# EAGLE design BioDes_HandProsthesis_PCB_V7 (EAGLE 9.6.2)

## Sheet 1 of 3
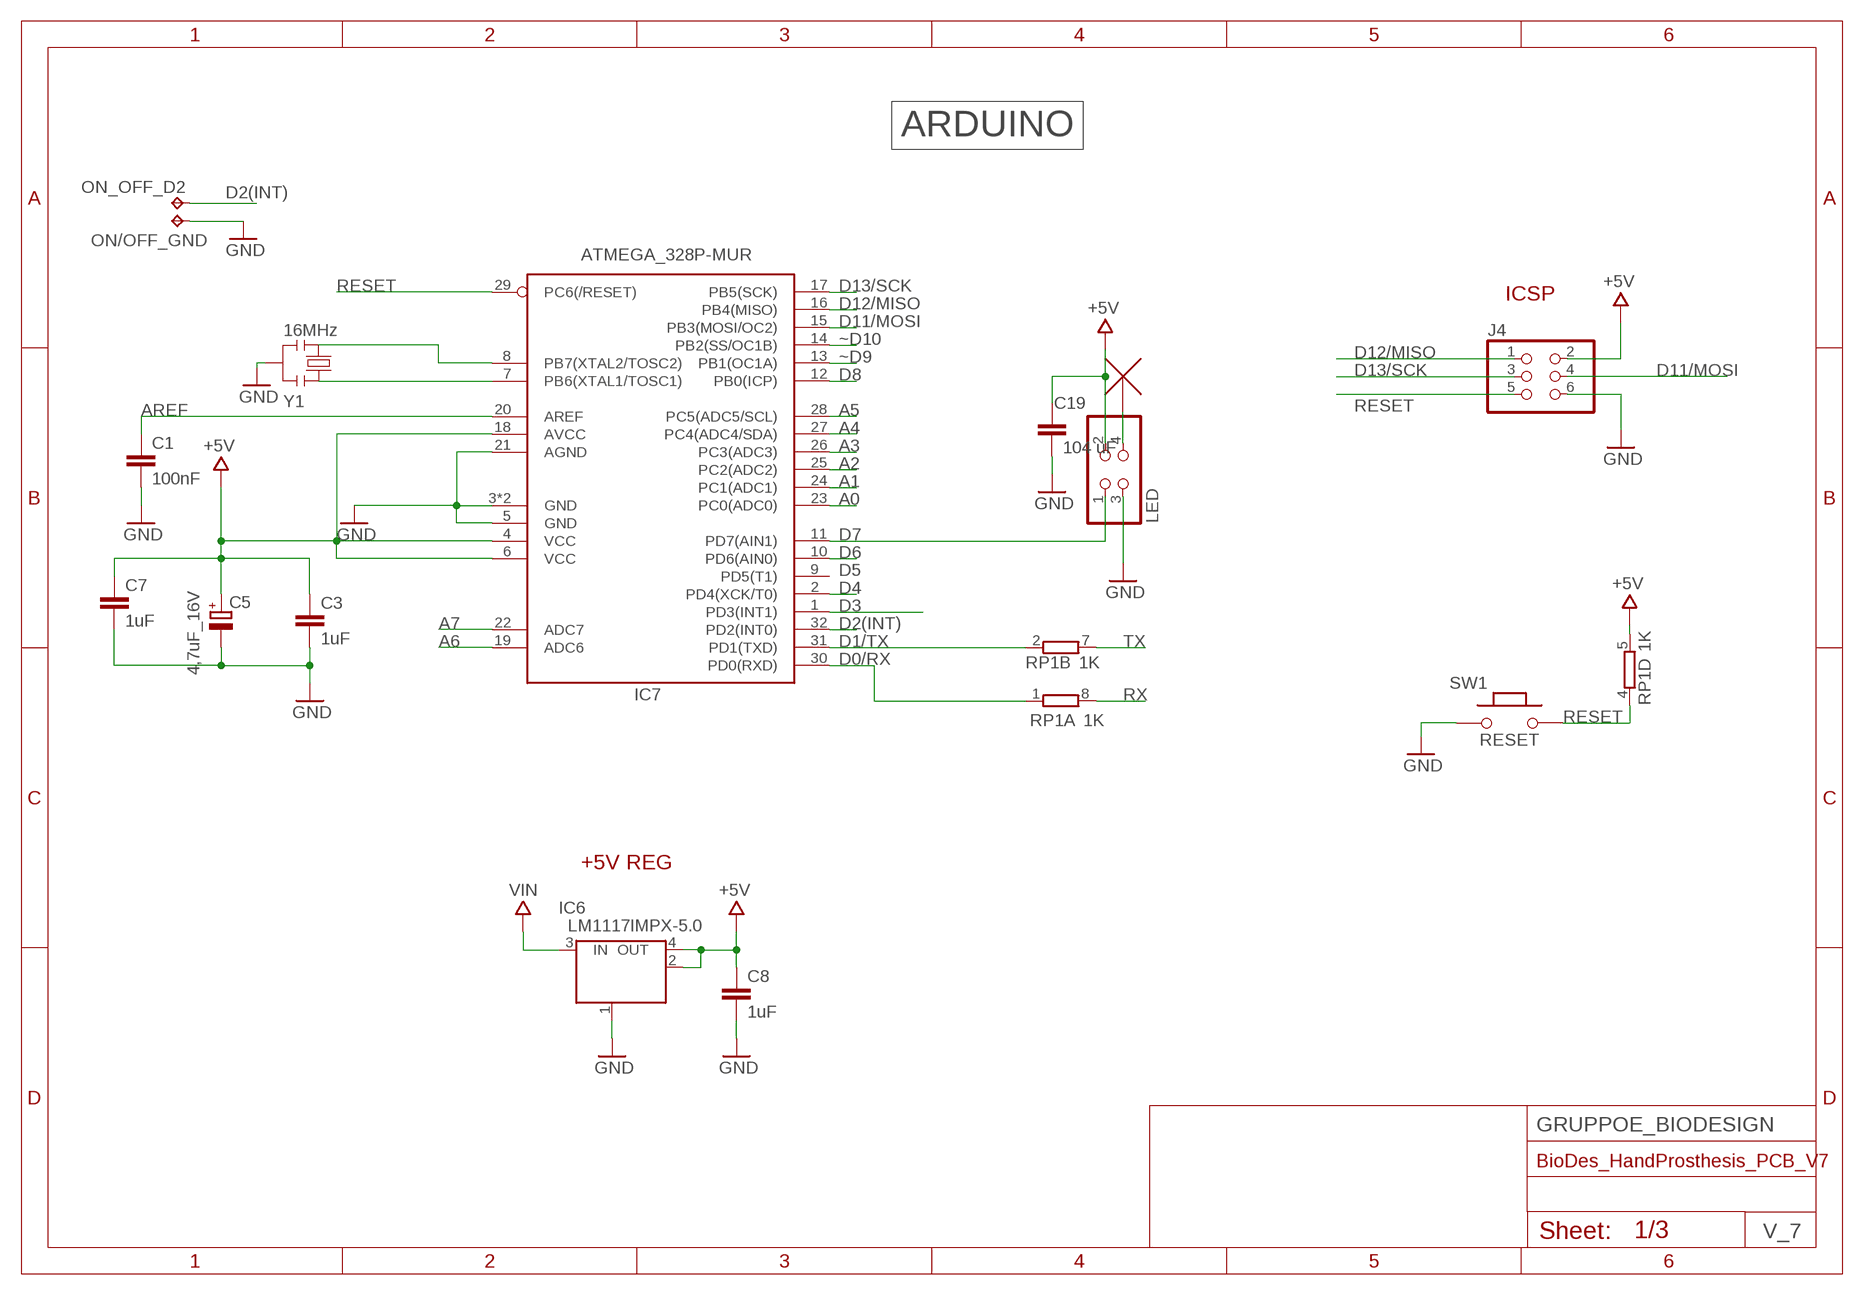
[diagram p0: schematic, sheet 1]

### Parts
C1  100nF  0015_100NF_0603  [C0603-ROUND]
C3  1uF  0006_1UF_0603/GRM188R61E105KA12D  [C0603-ROUND]
C5  4,7uF_16V  0833_TAJA475MO16RNJ  [TAN-A]
C7  1uF  0006_1UF_0603/GRM188R61E105KA12D  [C0603-ROUND]
C8  1uF  0006_1UF_0603/GRM188R61E105KA12D  [C0603-ROUND]
C19  104 uF  C-EUC0603  [C0603]
IC6  LM1117IMPX-5.0  0022_LM1117IMPX-5.0  [LINEAR_SOT223]
IC7  328P-MUR  ATMEGA328P-32MUR  [VQFN32]
J4  0114_PH254-203DF118A00V  [2X03]
LED  PINHD-2X2  [2X02]
ON/OFF_GND  TPB1,27  [B1,27]
ON_OFF_D2  TPB1,27  [B1,27]
RP1  1K  0005_064R_1K_/_CAY16-102J4LF  [CAY16]
SW1  RESET  0173_IT-1185AP1C-160G-G_T&R  [SMD_157SW]
U$7  NC_MARKER  (no package)
Y1  16MHz  0011_CSTCE16M0V53-R0  [RESONATOR]

### Nets
+5V: C3.1 C5.1(+) C7.1 C8.1 C19.1 IC6.2(OUT) IC6.4(OUT) IC7.4(VCC) IC7.6(VCC) IC7.18(AVCC) J4.2 LED.2 RP1.5 ; also sheet 2,3
A0: IC7.23(PC0(ADC0)) ; also sheet 2
A1: IC7.24(PC1(ADC1)) ; also sheet 2
A2: IC7.25(PC2(ADC2)) ; also sheet 2
A3: IC7.26(PC3(ADC3)) ; also sheet 2
A4: IC7.27(PC4(ADC4/SDA)) ; also sheet 2,3
A5: IC7.28(PC5(ADC5/SCL)) ; also sheet 2,3
A6: IC7.19(ADC6) ; also sheet 2
A7: IC7.22(ADC7) ; also sheet 2
AREF: C1.1 IC7.20(AREF)
D0/RX: IC7.30(PD0(RXD)) RP1.1
D1/TX: IC7.31(PD1(TXD)) RP1.2
D2(INT): IC7.32(PD2(INT0)) ON_OFF_D2.TP
D3: IC7.1(PD3(INT1)) ; also sheet 2
D4: IC7.2(PD4(XCK/T0)) ; also sheet 2
D6: IC7.10(PD6(AIN0)) ; also sheet 3
D7: IC7.11(PD7(AIN1)) LED.1
D8: IC7.12(PB0(ICP)) ; also sheet 2
D11/MOSI: IC7.15(PB3(MOSI/OC2)) J4.4
D12/MISO: IC7.16(PB4(MISO)) J4.1
D13/SCK: IC7.17(PB5(SCK)) J4.3
GND: C1.2 C3.2 C5.2(-) C7.2 C8.2 C19.2 IC6.1(GND/ADJ) IC7.3(GND) IC7.5(GND) IC7.21(AGND) IC7.33(GND) J4.6 LED.3 ON/OFF_GND.TP SW1.1 Y1.2 ; also sheet 2,3
N$3: LED.4 U$7.P$1
N$11: IC7.7(PB6(XTAL1/TOSC1)) Y1.1
N$12: IC7.8(PB7(XTAL2/TOSC2)) Y1.3
RESET: IC7.29(PC6(/RESET)) J4.5 RP1.4 SW1.2
RX: RP1.8 ; also sheet 2
TX: RP1.7 ; also sheet 2
VIN: IC6.3(IN) ; also sheet 3
~D9: IC7.13(PB1(OC1A)) ; also sheet 3
~D10: IC7.14(PB2(SS/OC1B)) ; also sheet 3
Unconnected: IC7.9(PD5(T1)) RP1.3 RP1.6

### Notes on the sheet
- ARDUINO
- ATMEGA_328P-MUR
- ICSP
- D5
- +5V REG
- GRUPPOE_BIODESIGN
- V_7

## Sheet 2 of 3
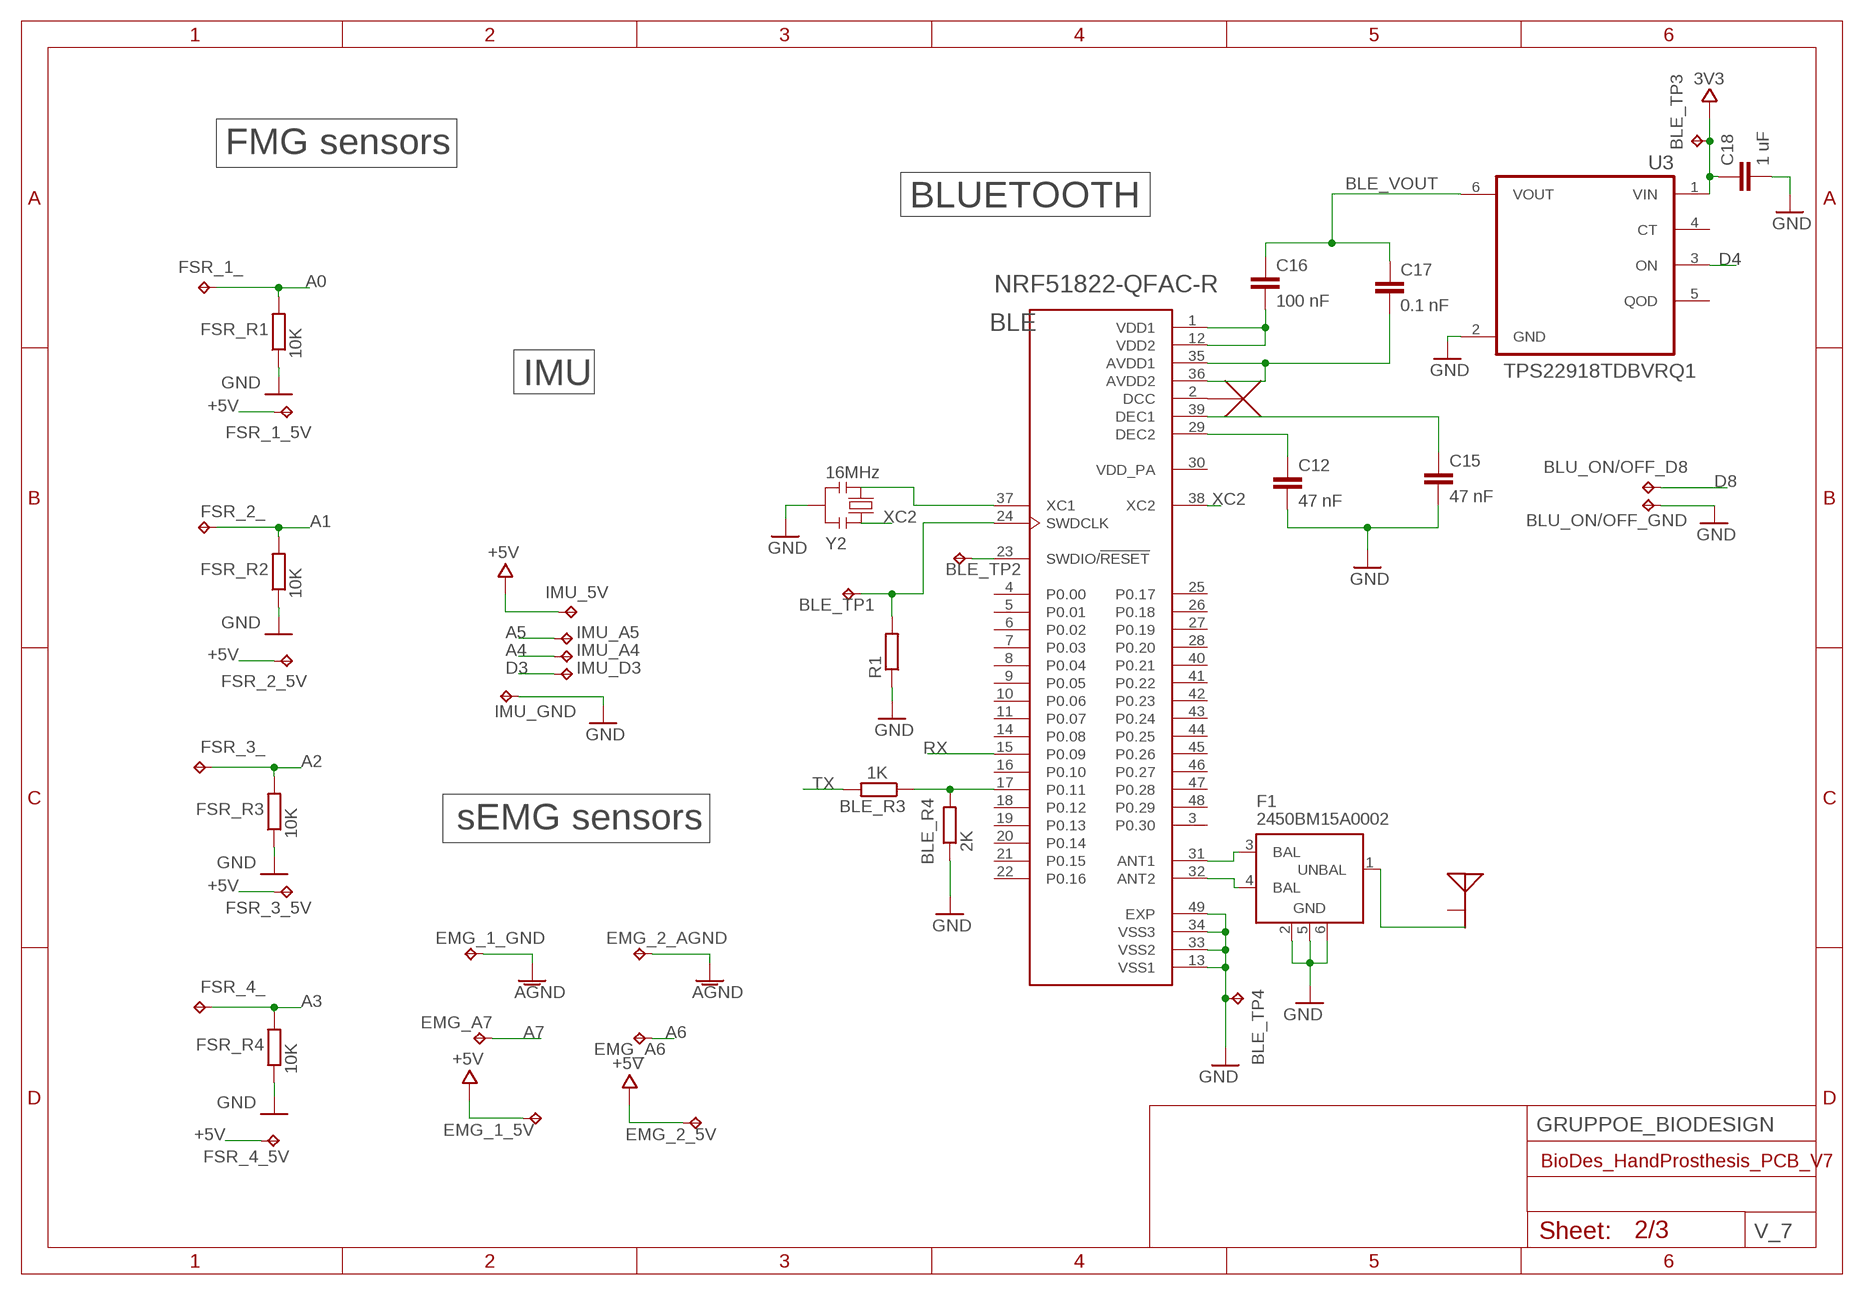
[diagram p1: schematic, sheet 2]

### Parts
BLE  NRF51822-QFAC-R  [QFN40P600X600X90-49N]
BLE_R3  1K  R-EU_R0603  [R0603]
BLE_R4  2K  R-EU_R0603  [R0603]
BLE_TP1  TPB1,27  [B1,27]
BLE_TP2  TPB1,27  [B1,27]
BLE_TP3  TPB1,27  [B1,27]
BLE_TP4  TPB1,27  [B1,27]
BLU_ON/OFF_D8  TPB1,27  [B1,27]
BLU_ON/OFF_GND  TPB1,27  [B1,27]
C12  47 nF  C-EUC0603  [C0603]
C15  47 nF  C-EUC0603  [C0603]
C16  100 nF  C-EUC0603  [C0603]
C17  0.1 nF  C-EUC0603  [C0603]
C18  1 uF  C-EUC0603  [C0603]
EMG_1_5V  TPB1,27  [B1,27]
EMG_1_GND  TPB1,27  [B1,27]
EMG_2_5V  TPB1,27  [B1,27]
EMG_2_AGND  TPB1,27  [B1,27]
EMG_A6  TPB1,27  [B1,27]
EMG_A7  TPB1,27  [B1,27]
F1  2450BM15A0002  [2450BM15A0002]
FSR_1_  TPB1,27  [B1,27]
FSR_1_5V  TPB1,27  [B1,27]
FSR_2_  TPB1,27  [B1,27]
FSR_2_5V  TPB1,27  [B1,27]
FSR_3_  TPB1,27  [B1,27]
FSR_3_5V  TPB1,27  [B1,27]
FSR_4_  TPB1,27  [B1,27]
FSR_4_5V  TPB1,27  [B1,27]
FSR_R1  10K  R-EU_R0603  [R0603]
FSR_R2  10K  R-EU_R0603  [R0603]
FSR_R3  10K  R-EU_R0603  [R0603]
FSR_R4  10K  R-EU_R0603  [R0603]
IMU_5V  TPB1,27  [B1,27]
IMU_A4  TPB1,27  [B1,27]
IMU_A5  TPB1,27  [B1,27]
IMU_D3  TPB1,27  [B1,27]
IMU_GND  TPB1,27  [B1,27]
R1  R-EU_R0603  [R0603]
U3  TPS22918TDBVRQ1  [SOT95P280X145-6N]
U$5  NC_MARKER  (no package)
U$11  MEANDER-ANT  [MEANDER-ANT]
Y2  16MHz  0011_CSTCE16M0V53-R0  [RESONATOR]

### Nets
3V3: BLE_TP3.TP C18.1 U3.1(VIN)
+5V: EMG_1_5V.TP EMG_2_5V.TP FSR_1_5V.TP FSR_2_5V.TP FSR_3_5V.TP FSR_4_5V.TP IMU_5V.TP ; also sheet 1,3
A0: FSR_1_.TP FSR_R1.2 ; also sheet 1
A1: FSR_2_.TP FSR_R2.2 ; also sheet 1
A2: FSR_3_.TP FSR_R3.2 ; also sheet 1
A3: FSR_4_.TP FSR_R4.2 ; also sheet 1
A4: IMU_A4.TP ; also sheet 1,3
A5: IMU_A5.TP ; also sheet 1,3
A6: EMG_A6.TP ; also sheet 1
A7: EMG_A7.TP ; also sheet 1
BLE_VOUT: C16.1 C17.1 U3.6(VOUT)
D3: IMU_D3.TP ; also sheet 1
D4: U3.3(ON) ; also sheet 1
D8: BLU_ON/OFF_D8.TP ; also sheet 1
GND: BLE.13(VSS1) BLE.33(VSS2) BLE.34(VSS3) BLE.49(EXP) BLE_R4.1 BLE_TP4.TP BLU_ON/OFF_GND.TP C12.2 C15.2 C18.2 EMG_1_GND.TP EMG_2_AGND.TP F1.2(GND) F1.5(GND) F1.6(GND) FSR_R1.1 FSR_R2.1 FSR_R3.1 FSR_R4.1 IMU_GND.TP R1.1 U3.2(GND) Y2.2 ; supply symbol labelled AGND ; also sheet 1,3
N$1: BLE.24(SWDCLK) BLE_TP1.TP R1.2
N$2: BLE.23(SWDIO/!RESET) BLE_TP2.TP
N$5: F1.1(UNBAL) U$11.FEED
N$6: BLE.31(ANT1) F1.3(BAL)
N$7: BLE.32(ANT2) F1.4(BAL)
N$8: BLE.29(DEC2) C12.1
N$9: BLE.17(P0.11) BLE_R3.1 BLE_R4.2
N$10: BLE.39(DEC1) C15.1
N$13: BLE.1(VDD1) BLE.12(VDD2) C16.2
N$14: BLE.35(AVDD1) BLE.36(AVDD2) C17.2
N$17: BLE.37(XC1) Y2.3
N$18: BLE.2(DCC) U$5.P$1
RX: BLE.15(P0.09) ; also sheet 1
TX: BLE_R3.2 ; also sheet 1
XC2: BLE.38(XC2) Y2.1
Unconnected: BLE.3(P0.30) BLE.4(P0.00) BLE.5(P0.01) BLE.6(P0.02) BLE.7(P0.03) BLE.8(P0.04) BLE.9(P0.05) BLE.10(P0.06) BLE.11(P0.07) BLE.14(P0.08) BLE.16(P0.10) BLE.18(P0.12) BLE.19(P0.13) BLE.20(P0.14) BLE.21(P0.15) BLE.22(P0.16) BLE.25(P0.17) BLE.26(P0.18) BLE.27(P0.19) BLE.28(P0.20) BLE.30(VDD_PA) BLE.40(P0.21) BLE.41(P0.22) BLE.42(P0.23) BLE.43(P0.24) BLE.44(P0.25) BLE.45(P0.26) BLE.46(P0.27) BLE.47(P0.28) BLE.48(P0.29) U3.4(CT) U3.5(QOD) U$11.GND

### Notes on the sheet
- FMG sensors
- BLUETOOTH
- IMU
- sEMG sensors
- GRUPPOE_BIODESIGN
- V_7

## Sheet 3 of 3
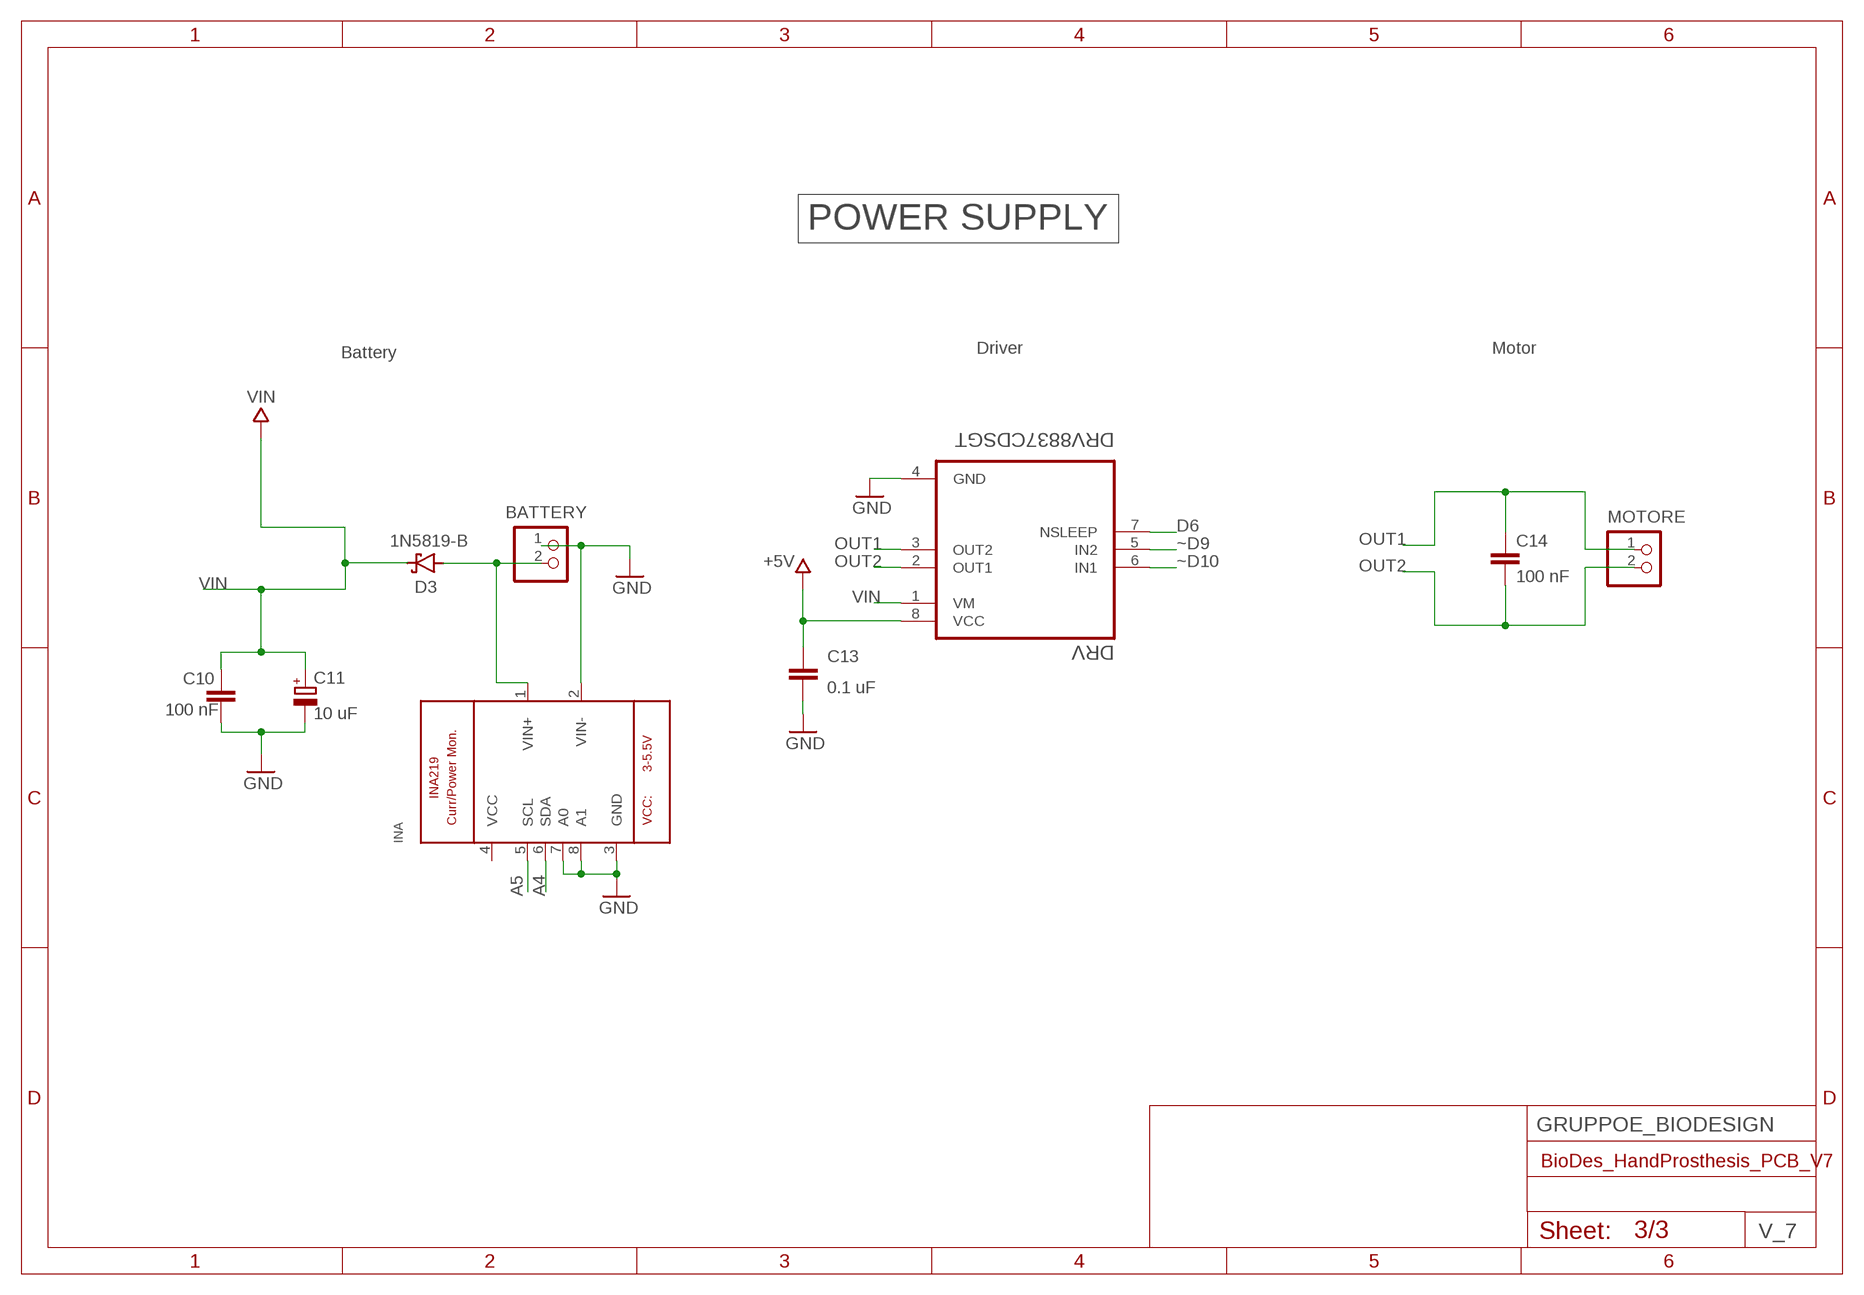
[diagram p2: schematic, sheet 3]

### Parts
BATTERY  PINHD-1X2/90  [1X02/90]
C10  100 nF  C-EUC0603  [C0603]
C11  10 uF  CPOL-EUA/3216-18R  [A/3216-18R]
C13  0.1 uF  C-EUC0603  [C0603]
C14  100 nF  C-EUC0603  [C0603]
D3  1N5819-B  [DO41-7.6]
DRV  DRV8837CDSGT  [SON50P200X200X80-9N]
INA  INA219  [SOT23-8]
MOTORE  PINHD-1X2/90  [1X02/90]

### Nets
+5V: C13.1 DRV.8(VCC) ; also sheet 1,2
A4: INA.6(SDA) ; also sheet 1,2
A5: INA.5(SCL) ; also sheet 1,2
D6: DRV.7(NSLEEP) ; also sheet 1
GND: BATTERY.1 C10.2 C11.- C13.2 DRV.4(GND) INA.2(VIN-) INA.3(GND) INA.7(A0) INA.8(A1) ; also sheet 1,2
N$4: BATTERY.2 D3.A INA.1(VIN+)
OUT1: C14.1 DRV.3(OUT2) MOTORE.1
OUT2: C14.2 DRV.2(OUT1) MOTORE.2
VIN: C10.1 C11.+ D3.C DRV.1(VM) ; also sheet 1
~D9: DRV.5(IN2) ; also sheet 1
~D10: DRV.6(IN1) ; also sheet 1
Unconnected: INA.4(VCC)

### Notes on the sheet
- POWER SUPPLY
- Battery | Driver | Motor
- GRUPPOE_BIODESIGN
- V_7

## Library data of the parts
BATTERY MOTORE = pinhead:PINHD-1X2: PIN HEADER; OC_FARNELL: unknown
BLE = NRF51822-QFAC-R:NRF51822-QFAC-R: Check availability <https://pricing.snapeda.com/parts/NRF51822-QFAC-R/Nordic%20Semiconductor/view-part?ref=eda>; AVAILABILITY: In Stock; CHECK_PRICES: https://www.snapeda.com/parts/NRF51822-QFAC-R/Nordic+Power/view-part/?ref=eda; DESCRIPTION: IC RF TxRx + MCU Bluetooth, General ISM > 1GHz Bluetooth v4.0 2.4GHz 48-VFQFN Exposed Pad; MF: NORDIC SEMICONDUCTOR; MP: NRF51822-QFAC-R; MPN: NRF51822-QFAC-R7; OC_FARNELL: 2842309; PACKAGE: VFQFN-48 Nordic Semiconductor; PRICE: None; PURCHASE-URL: https://www.snapeda.com/api/url_track_click_mouser/?unipart_id=50057&manufacturer=Nordic Semiconductor&part_name=NRF51822-QFAC-R&search_term=nrf51822; SNAPEDA_LINK: https://www.snapeda.com/parts/NRF51822-QFAC-R/Nordic+Power/view-part/?ref=snap
BLE_R3 = rcl:R-EU_: RESISTOR, European symbol; MF: VISHAY; MPN: CRCW04021K00FKED; OC_FARNELL: 2121603; SPICEPREFIX: R
BLE_R4 = rcl:R-EU_: RESISTOR, European symbol; MF: MICROCHIP; MPN: 47L16-I/P; OC_FARNELL: 2674852; SPICEPREFIX: R
BLE_TP1-BLE_TP4 EMG_A6 EMG_A7 IMU_A4 IMU_A5 IMU_D3 = testpad:TP: Test pad; OC_FARNELL: unknown
BLU_ON/OFF_D8 BLU_ON/OFF_GND EMG_1_5V EMG_1_GND EMG_2_5V EMG_2_AGND FSR_1_ FSR_1_5V FSR_2_ FSR_2_5V FSR_3_ FSR_3_5V FSR_4_ FSR_4_5V IMU_5V IMU_GND ON/OFF_GND ON_OFF_D2 = testpad:TP: Test pad
C1 = Condensatori:0015_100NF_0603: 100nF 0603 50V; CASE: 0603; MF: KEMET; MONTHLY_USAGE: _____; MPN: C0603C104K3RACTU; OC_FARNELL: 1650835; PART_NUMBER: cl10b104kbnc; PRICE: _____; SUPPLIER: _____; TYPE: Condensatori
C3 C7 C8 = Condensatori:0006_1UF_0603/GRM188R61E105KA12D: 1uF 0603; CASE: 0603; MF: KEMET; MONTHLY_USAGE: _____; MPN: C1210F105K5RACTU; OC_FARNELL: 1288278; PART_NUMBER: 1uF_0603/GRM188R61E105KA12D; PRICE: _____; SUPPLIER: _____; TYPE: Condensatori
C5 = Condensatori:0833_TAJA475MO16RNJ: 4,7uF; CASE: Case_A_(1206); MF: KEMET; MONTHLY_USAGE: _____; MPN: T491A475K016AT; OC_FARNELL: 2250101; PART_NUMBER: TAJA475MO16RNJ; PRICE: _____; SUPPLIER: _____; TYPE: Condensatori
C10 C13 C14 C16 = rcl:C-EU: CAPACITOR, European symbol; MF: KEMET; MPN: C0603C104K3RACTU; OC_FARNELL: 1650835; SPICEPREFIX: C
C11 = rcl:CPOL-EU: POLARIZED CAPACITOR, European symbol; MF: TDK; MPN: CGA5L1X7R1E106K160AC; OC_FARNELL: 2458327; SPICEPREFIX: C
C12 C15 = rcl:C-EU: CAPACITOR, European symbol; MF: VISHAY; MPN: MKT1813347405; OC_FARNELL: 2860198; SPICEPREFIX: C
C17 = rcl:C-EU: CAPACITOR, European symbol; MF: YAGEO; MPN: CC0402JRNPO9BN101; OC_FARNELL: 3019226; SPICEPREFIX: C
C18 = rcl:C-EU: CAPACITOR, European symbol; MF: KEMET; MPN: C1210F105K5RACTU; OC_FARNELL: 1288278; SPICEPREFIX: C
C19 = rcl:C-EU: CAPACITOR, European symbol; OC_FARNELL: unknown; SPICEPREFIX: C
D3 = diode:1N581*: 1.0A SCHOTTKY BARRIER RECTIFIER Source: http://www.diodes.com/datasheets/ds23001.pdf; MF: VISHAY; MPN: 1N5819-E3/54; OC_FARNELL: 1336533
DRV = DRV8837CDSGT:DRV8837CDSGT: Check availability <https://pricing.snapeda.com/parts/DRV8837CDSGT/Texas%20Instruments/view-part?ref=eda>; AVAILABILITY: In Stock; CHECK_PRICES: https://www.snapeda.com/parts/DRV8837CDSGT/Texas+Instruments/view-part/?ref=eda; DESCRIPTION: 12-V, 1-A H-bridge motor driver; MP: DRV8837CDSGT; MPN: DRV8832DGQR; OC_FARNELL: 3118937; PACKAGE: WSON-8 Texas Instruments; PRICE: None; PURCHASE-URL: https://www.snapeda.com/api/url_track_click_mouser/?unipart_id=572620&manufacturer=Texas Instruments&part_name=DRV8837CDSGT&search_term=None; SNAPEDA_LINK: https://www.snapeda.com/parts/DRV8837CDSGT/Texas+Instruments/view-part/?ref=snap
F1 = johanson-technology:2450BM15A0002: 2.45 GHz Impedance Matched Balun-Filter For TI CC253X/CC2540 Chipset family Data sheet <http://www.johansontechnology.com/images/stories/ip/baluns/balun_filter_combo_matched_2450bm15a0002_v8.pdf>; MF: JOHANSON TECHNOLOGY; MPN: 2450BM15A0002E; OC_FARNELL: 1885515
FSR_R1-FSR_R4 = rcl:R-EU_: RESISTOR, European symbol; MF: VISHAY; MPN: CRCW080510K0FKEA; OC_FARNELL: 2123255; SPICEPREFIX: R
IC6 = IntegratedCircuits:0022_LM1117IMPX-5.0: Low-dropout linear regulator 5V -LM1117IMPX-5.0; CASE: SOT223; MF: ONSEMI; MONTHLY_USAGE: _____; MPN: NCP1117ST50T3G; OC_FARNELL: 2112617; PART_NUMBER: LM1117IMPX-5.0; PRICE: _____; SUPPLIER: _____; TYPE: Circuito_Integrato
IC7 = Arduino-ucs&SoCs:ATMEGA328P-32: 8-bit Microcontroller with 32KBytes In-System Programmable Flash ATMEGA328P-AU; DATASHEET: http://www.atmel.com/images/Atmel-8271-8-bit-AVR-Microcontroller-ATmega48A-48PA-88A-88PA-168A-168PA-328-328P_datasheet_Complete.pdf; DISTRIBUTOR-LINK: https://www.digikey.it/product-detail/it/microchip-technology/ATMEGA328P-MUR/ATMEGA328P-MURCT-ND/3440953; DISTRIBUTOR-PN: ATMEGA328P-MURCT-ND; MANUFACTURER: ATMEL; MANUFACTURER-PN: ATMEGA328P-MUR; OC_FARNELL: unknown
INA = INA219:INA219: INA219 - I2C Current/Power Monitor Voltage Range: 0-26V Accuracy: 0.5% Temperature: -40°C - 125°C; MF: ANALOG DEVICES; MPN: MAX6369KA+T; OC_FARNELL: 2519138
J4 = Connettori:0114_PH254-203DF118A00V: 3x2 M V h 8,5 mm p2,54; MF: TE CONNECTIVITY / PARTNER STOCK; MONTHLY_USAGE: _____; MPN: 350732-4; OC_FARNELL: 4547599; PART_NUMBER: PH254-203DF118A00V; PRICE: _____; SUPPLIER: _____; TYPE: Connettori; VALUE: ICSP
LED = pinhead:PINHD-2X2: PIN HEADER; OC_FARNELL: unknown
R1 = rcl:R-EU_: RESISTOR, European symbol; MF: KEMET; MPN: SS21V-R060330; OC_FARNELL: 2364321; SPICEPREFIX: R
RP1 = Resistenze:0005_064R_1K_/_CAY16-102J4LF: 1K 064R; CASE: SMD_3,2x1,6; MF: VISHAY; MONTHLY_USAGE: _____; MPN: CRCW04021K00FKED; OC_FARNELL: 2121603; PART_NUMBER: 064R_1K_/_CAY16-102J4LF; PRICE: _____; SUPPLIER: _____; TYPE: Resistenze
SW1 = Switches:0173_IT-1185AP1C-160G-G_T&R: Pushbutton 4x3 SMD H2,5mm; MF: ANALOG DEVICES; MONTHLY_USAGE: _____; MPN: MAX1232CPA+; OC_FARNELL: 2519318; PART_NUMBER: IT-1185AP1C-160G-G_T&R; PRICE: _____; SUPPLIER: _____; TYPE: Switches; VALUE: 157SW
U3 = TPS22918TDBVRQ1:TPS22918TDBVRQ1; CHECK_PRICES: https://www.snapeda.com/parts/TPS22918TDBVRQ1/Texas+Instruments/view-part/?ref=eda; DESCRIPTION: 1-ch, 5.5-V, 2-A, 52-mΩ automotive load switch with adj. rise time and adj. output discharg; DIGIKEY_PART_NUMBER: 296-44632-1-ND; MP: TPS22918TDBVRQ1; MPN: TPS22945DCKR; OC_FARNELL: 3008909; PACKAGE: SOT-23-6 Texas Instruments; SNAPEDA_LINK: https://www.snapeda.com/parts/TPS22918TDBVRQ1/Texas+Instruments/view-part/?ref=snap
U$5 U$7 = NC_MARKER:NC_MARKER
U$11 = Antennas:MEANDER-ANT; OC_FARNELL: unknown
Y1 Y2 = Cristalli:0011_CSTCE16M0V53-R0: 16Mhz - SMD; MF: MICROCHIP; MONTHLY_USAGE: _____; MPN: ATMEGA16U2-AU; OC_FARNELL: 1841607; PART_NUMBER: CSTCE16M0V53-R0; PRICE: _____; SUPPLIER: _____; TYPE: Cristalli; VALUE: CSTCE16M0V53-R0

## Board
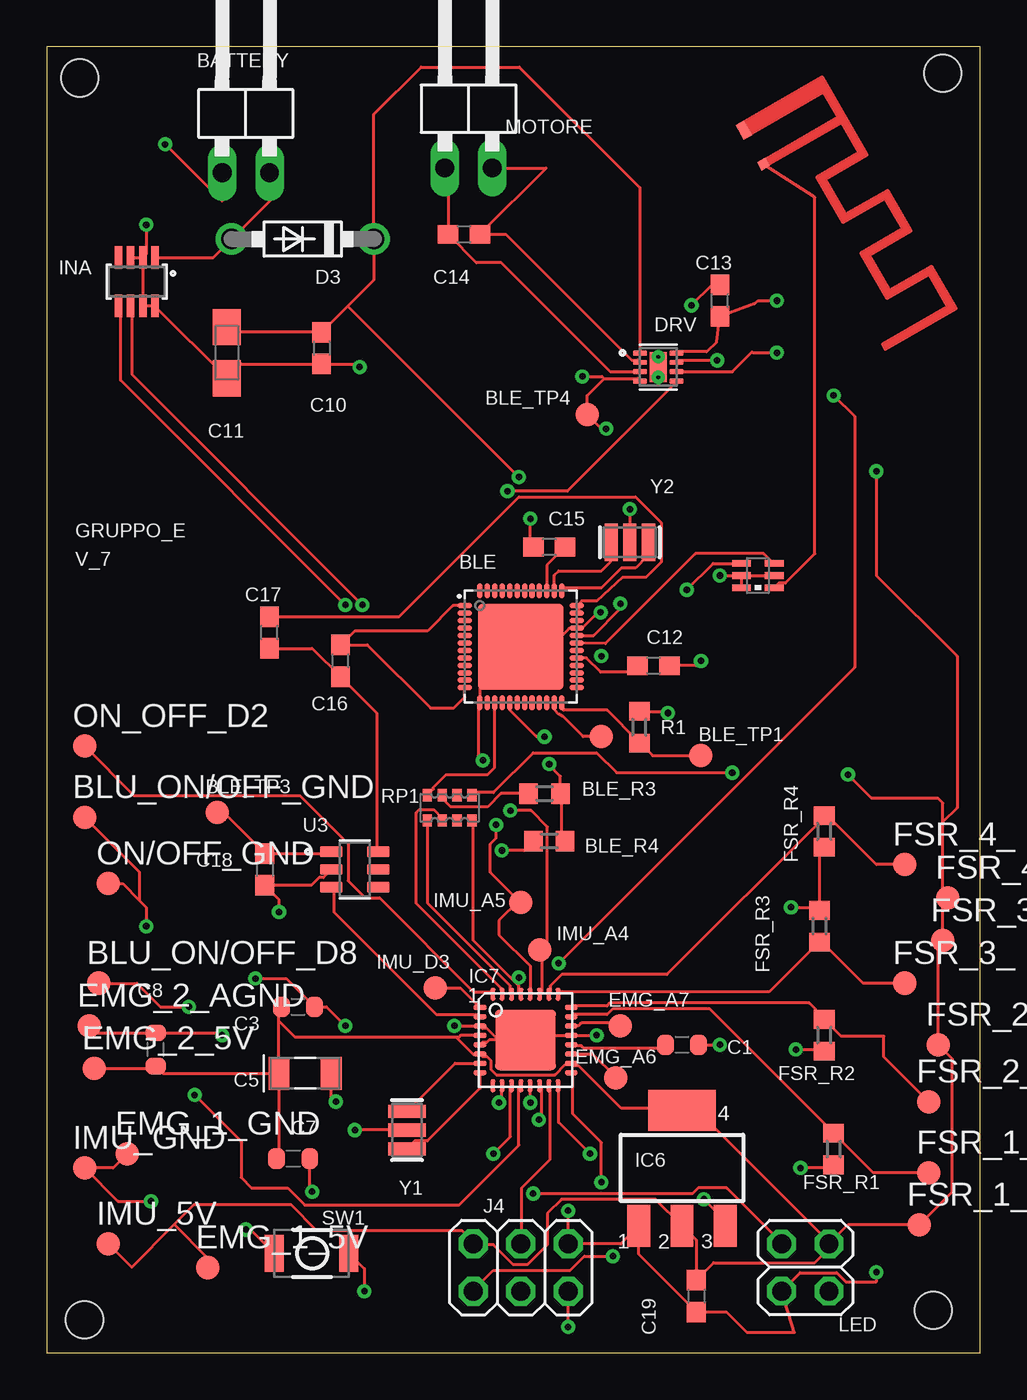
[diagram p3: board, top side]
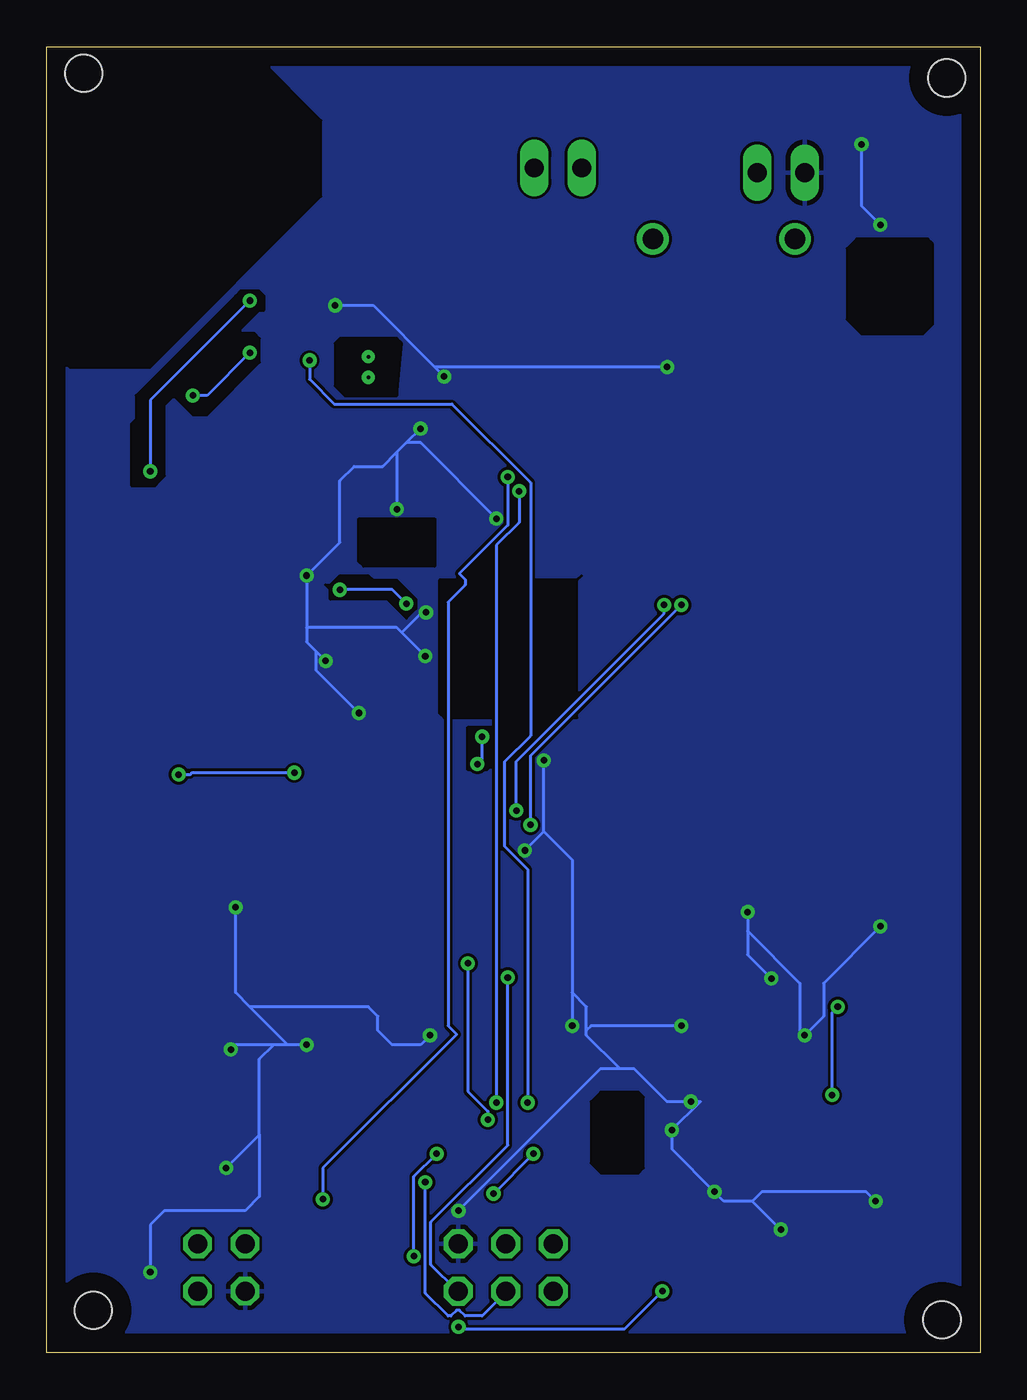
[diagram p4: board, bottom side, seen from below]

Size 50 x 70 mm. Coordinates in mm from the lower left corner, seen from the top.
Outline: 0,0 50,0 50,70 0,70 0,0
Copper layers (1*16): Top 0.035mm / dielectric 1.5mm / Bottom 0.035mm
Design rules "default *": minimum track width 6mil, minimum drill 0.1mm, track to track 6mil, track to pad 6mil, pad to pad 6mil, via to via 6mil, smd to smd 6mil, copper to edge 40mil, drill to drill 6mil, minimum pad ring 10mil, minimum via ring 8mil, stop-mask expansion 4mil, vias tented up to drill 0mil, thermal gap 10mil
Holes 2 mm at 2.03,1.78 47.5,2.29 48.01,68.58 1.78,68.33

### Footprints (pad centres in the part's own frame; a part is rotated, then mirrored left to right if it is on the bottom)
1X02/90 = drill 1.016 long: 1 -1.27,-3.81; 2 1.27,-3.81
QFN40P600X600X90-49N = smd 0.8 x 0.3: 1 -3,2.2; 2 -3,1.8; 3 -3,1.4; 4 -3,1; 5 -3,0.6; 6 -3,0.2; 7 -3,-0.2; 8 -3,-0.6; 9 -3,-1; 10 -3,-1.4; 11 -3,-1.8; 12 -3,-2.2; 25 3,-2.2; 26 3,-1.8; 27 3,-1.4; 28 3,-1; 29 3,-0.6; 30 3,-0.2; 31 3,0.2; 32 3,0.6; 33 3,1; 34 3,1.4; 35 3,1.8; 36 3,2.2 | smd 0.3 x 0.8: 13 -2.2,-3; 14 -1.8,-3; 15 -1.4,-3; 16 -1,-3; 17 -0.6,-3; 18 -0.2,-3; 19 0.2,-3; 20 0.6,-3; 21 1,-3; 22 1.4,-3; 23 1.8,-3; 24 2.2,-3; 37 2.2,3; 38 1.8,3; 39 1.4,3; 40 1,3; 41 0.6,3; 42 0.2,3; 43 -0.2,3; 44 -0.6,3; 45 -1,3; 46 -1.4,3; 47 -1.8,3; 48 -2.2,3 | smd 4.6 x 4.6: 49 0,0
R0603 = smd 1 x 1.1: 1 -0.85,0; 2 0.85,0
B1,27 = smd 1.27 x 1.27: TP 0,0
C0603-ROUND = smd 0.898 x 1.1: 1 -0.889,0; 2 0.889,0
TAN-A = smd 1.118 x 1.778: 1 0,0; 2 2.794,0
C0603 = smd 1.1 x 1: 1 -0.85,0; 2 0.85,0
A/3216-18R = smd 1.95 x 1.5: + 1.375,0; - -1.375,0
DO41-7.6 = drill 1.1 pad 1.7: A 3.81,0; C -3.81,0
SON50P200X200X80-9N = smd 0.74 x 0.28: 1 -0.985,0.75; 2 -0.985,0.25; 3 -0.985,-0.25; 4 -0.985,-0.75; 5 0.985,-0.75; 6 0.985,-0.25; 7 0.985,0.25; 8 0.985,0.75 | smd 0.9 x 1.6: 9 0,0 | drill 0.2 pad 0.4: 9_1 0,0.55; 9_2 0,-0.55
2450BM15A0002 = smd 0.35 x 1: 1 -0.65,-0.875; 2 0,-0.875; 3 0.65,-0.875; 4 0.65,0.875; 5 0,0.875; 6 -0.65,0.875
LINEAR_SOT223 = smd 1.219 x 2.235: 1 -2.311,-3.099; 2 0,-3.099; 3 2.311,-3.099 | smd 3.6 x 2.2: 4 0,3.099
VQFN32 = smd 0.7 x 0.28: 1 -2.45,1.75; 2 -2.45,1.25; 3 -2.45,0.75; 4 -2.45,0.25; 5 -2.45,-0.25; 6 -2.45,-0.75; 7 -2.45,-1.25; 8 -2.45,-1.75; 17 2.45,-1.75; 18 2.45,-1.25; 19 2.45,-0.75; 20 2.45,-0.25; 21 2.45,0.25; 22 2.45,0.75; 23 2.45,1.25; 24 2.45,1.75 | smd 0.28 x 0.7: 9 -1.75,-2.45; 10 -1.25,-2.45; 11 -0.75,-2.45; 12 -0.25,-2.45; 13 0.25,-2.45; 14 0.75,-2.45; 15 1.25,-2.45; 16 1.75,-2.45; 25 1.75,2.45; 26 1.25,2.45; 27 0.75,2.45; 28 0.25,2.45; 29 -0.25,2.45; 30 -0.75,2.45; 31 -1.25,2.45; 32 -1.75,2.45 | smd 3.254 x 3.254: 33 0,0
SOT23-8 = smd 0.4 x 1.2: 1 -0.975,-1.3; 2 -0.325,-1.3; 3 0.325,-1.3; 4 0.975,-1.3; 5 0.975,1.3; 6 0.325,1.3; 7 -0.325,1.3; 8 -0.975,1.3
2X03 = drill 1.016 pad 1.55 octagon: 1 -2.54,-1.27; 2 -2.54,1.27; 3 0,-1.27; 4 0,1.27; 5 2.54,-1.27; 6 2.54,1.27
2X02 = drill 1.016 octagon: 1 -1.27,-1.27; 2 -1.27,1.27; 3 1.27,-1.27; 4 1.27,1.27
CAY16 = smd 0.5 x 0.65: 1 -1.2,-0.675; 2 -0.4,-0.675; 3 0.4,-0.675; 4 1.2,-0.675; 5 1.2,0.675; 6 0.4,0.675; 7 -0.4,0.675; 8 -1.2,0.675
SMD_157SW = smd 1.016 x 1.981: 1 0,0; 2 4,0
SOT95P280X145-6N = smd 1.21 x 0.58: 1 -1.255,0.95; 2 -1.255,0; 3 -1.255,-0.95; 4 1.255,-0.95; 5 1.255,0; 6 1.255,0.95
MEANDER-ANT = smd 0.5 x 0.5: FEED 2.55,-0.25 | smd 0.9 x 0.5: GND 0.45,-0.25
RESONATOR = smd 0.7 x 2: 1 -1,0; 2 0,0; 3 1,0

### Placement (x,y rotation side)
BATTERY  10.67,67.06 0 top
BLE  25.4,37.85 0 top
BLE_R3  26.67,29.97 180 top
BLE_R4  26.92,27.43 0 top
BLE_TP1  35.05,32 0 top
BLE_TP2  29.72,33.02 0 top
BLE_TP3  9.14,28.96 0 top
BLE_TP4  28.96,50.29 0 top
BLU_ON/OFF_D8  2.79,19.81 0 top
BLU_ON/OFF_GND  2.03,28.7 0 top
C1  34.04,16.51 0 top
C3  13.46,18.54 0 top
C5  12.45,14.99 0 top
C7  13.21,10.41 0 top
C8  5.84,16.26 90 top
C10  14.73,53.85 270 top
C11  9.65,53.59 90 top
C12  32.51,36.83 0 top
C13  36.07,56.39 90 top
C14  22.35,59.94 0 top
C15  26.92,43.18 180 top
C16  15.75,37.08 90 top
C17  11.94,38.61 90 top
C18  11.68,25.91 270 top
C19  34.8,3.05 270 top
D3  13.72,59.69 180 top
DRV  32.77,52.83 0 top
EMG_1_5V  8.64,4.57 0 top
EMG_1_GND  4.32,10.67 0 top
EMG_2_5V  2.54,15.24 0 top
EMG_2_AGND  2.29,17.53 0 top
EMG_A6  30.48,14.73 0 top
EMG_A7  30.73,17.53 0 top
F1  38.1,41.66 90 top
FSR_1_  47.24,9.65 0 top
FSR_1_5V  46.74,6.86 0 top
FSR_2_  47.24,13.46 0 top
FSR_2_5V  47.75,16.51 0 top
FSR_3_  45.97,19.81 0 top
FSR_3_5V  48.01,22.1 0 top
FSR_4_  45.97,26.16 0 top
FSR_4_5V  48.26,24.38 0 top
FSR_R1  42.16,10.92 90 top
FSR_R2  41.66,17.02 90 top
FSR_R3  41.4,22.86 270 top
FSR_R4  41.66,27.94 90 top
IC6  34.04,9.91 0 top
IC7  25.65,16.76 0 top
IMU_5V  3.3,5.84 0 top
IMU_A4  26.42,21.59 0 top
IMU_A5  25.4,24.13 0 top
IMU_D3  20.83,19.56 0 top
IMU_GND  2.03,9.91 0 top
INA  4.83,57.4 180 top
J4  25.4,4.57 0 top
LED  40.64,4.57 270 top
MOTORE  22.61,67.31 0 top
ON/OFF_GND  3.3,25.15 0 top
ON_OFF_D2  2.03,32.51 0 top
R1  31.75,33.53 270 top
RP1  21.59,29.21 0 top
SW1  12.19,5.33 0 top
U3  16.51,25.91 0 top
U$11  37.34,66.04 300 top
Y1  19.3,11.94 270 top
Y2  31.24,43.43 0 top

### Tracks (layer width: path | path; a pad name or v marks a point on that pad's centre or on a via)
3V3
  Top 0.152: BLE_TP3.TP 9.49,28.96 C18.1 15.15,26.76 U3.1
+5V  (via drill 0.35)
  Top 0.152: C5.1 6.22,14.99 C8.1 5.84,15.24 EMG_2_5V.TP | C5.1 12.45,10.54 C7.1 | C5.1 12.45,17.78 | 12.45,17.78 12.45,18.41 C3.1 | IC7.4 22.19,17.01 22.09,16.92 21.95,16.92 | 21.95,16.92 13.31,16.92 12.45,17.78 | LED.2 41.91,5.59 41.15,4.83 35.73,4.83 C19.1 34.8,6.04 IC6.2 32.61,8.23 27.58,8.23 26.82,7.47 26.82,5.79 25.76,4.72 24.99,4.72 23.93,5.79 22.86,5.79 J4.2 22.86,5.94 22.25,6.55 14.48,6.55 13.11,7.92 7.87,7.92 6.83,6.88 | DRV.8 33.83,53.65 35.36,53.65 35.88,54.17 C13.1 37.93,56.22 38.1,56.39 v39.12,56.39 | RP1.5 22.86,30.02 23.93,30.02 26.06,32.16 29.46,32.16 30.53,31.09 v36.73,31.09 | 21.95,16.92 22.86,16 23.16,16 IC7.6 23.34,15.88 23.58,15.88 23.8,15.67 23.8,15.19 24.07,14.91 27.23,14.91 27.78,15.46 28.14,15.46 | 28.14,15.46 28.19,15.39 28.5,15.39 30.79,13.11 33.98,13.11 IC6.4 34.14,12.95 34.9,12.95 41.91,5.94 LED.2 | 28.14,15.46 IC7.18 | v44.45,47.24 44.45,41.66 48.77,37.34 48.77,29.21 48.01,28.45 | 48.01,28.45 48.01,29.46 47.75,29.72 44.2,29.72 v42.93,30.99 | 6.83,6.88 4.55,4.6 IMU_5V.TP | EMG_1_5V.TP 8.64,5.08 6.83,6.88 | LED.2 42.93,6.86 FSR_1_5V.TP 48.51,8.64 48.51,15.75 FSR_2_5V.TP 47.75,21.84 FSR_3_5V.TP 48.01,24.13 FSR_4_5V.TP 48.01,24.64 48.01,28.45
  Bottom 0.152: v36.73,31.09 42.22,31.09 42.32,30.99 v42.93,30.99 | v39.12,56.39 44.45,51.05 v44.45,47.24
A0
  Top 0.152: IC7.23 28.19,18.14 30.02,18.14 30.33,18.44 35.51,18.44 42.06,11.89 FSR_R1.2 44.28,9.65 FSR_1_.TP
A1
  Top 0.152: IC7.24 28.19,18.59 30.02,18.59 30.18,18.75 40.84,18.75 41.6,17.98 FSR_R2.2 42.56,16.97 44.86,16.97 44.86,15.85 FSR_2_.TP
A2
  Top 0.152: IC7.25 27.43,19.36 38.71,19.36 41.3,21.95 FSR_R3.2 41.45,22.1 43.74,19.81 FSR_3_.TP
A3
  Top 0.152: IC7.26 26.98,19.36 26.98,19.66 27.58,20.27 33.22,20.27 41.6,28.65 FSR_R4.2 41.76,28.8 41.81,28.8 44.45,26.16 FSR_4_.TP
A4  (via drill 0.35)
  Top 0.152: IC7.27 26.52,19.36 26.52,21.49 IMU_A4.TP 26.52,21.64 26.82,21.95 26.82,28.19 25.96,29.06 v24.84,29.06 | v16.92,40.08 4.57,52.43 4.57,56.08 INA.6
  Bottom 0.152: v16.92,40.08 16.92,39.62 24.84,31.7 v24.84,29.06
A5  (via drill 0.35)
  Top 0.152: 25.3,24.23 24.23,23.16 24.23,22.4 25.91,20.73 25.91,19.36 IC7.28 | v16,40.08 3.96,52.12 3.96,56.08 INA.5 | v24.08,28.3 24.08,27.58 23.77,27.28 23.77,25.76 25.3,24.23 | 25.3,24.23 IMU_A5.TP
  Bottom 0.152: v16,40.08 24.08,32 v24.08,28.3
A6
  Top 0.152: IC7.19 28.19,16 29.26,16 30.48,14.78 EMG_A6.TP
A7
  Top 0.152: IC7.22 28.19,17.53 28.5,17.53 28.65,17.68 30.48,17.68 30.63,17.53 EMG_A7.TP
AREF
  Top 0.152: IC7.20 28.19,16.46 28.65,16.46 28.8,16.31 32.92,16.31 33.07,16.46 C1.1
BLE_VOUT
  Top 0.152: C17.1 14.22,37.76 C16.1 15.85,36.12 17.68,34.29 17.68,26.98 U3.6
D0/RX
  Top 0.152: RP1.1 20.42,28.5 20.42,24.08 24.84,19.66 24.84,19.36 IC7.30
D1/TX
  Top 0.152: RP1.2 21.18,28.65 20.73,29.11 19.96,29.11 19.81,28.96 19.81,24.08 24.38,19.51 24.38,19.36 IC7.31
D2(INT)
  Top 0.152: IC7.32 23.77,19.36 22.86,19.36 17.83,24.38 17.07,24.38 16.15,25.3 16.15,27.28 13.56,29.87 5.59,29.87 4.67,29.87 ON_OFF_D2.TP
D3
  Top 0.152: IMU_D3.TP 22.16,19.56 IC7.1
D4
  Top 0.152: IC7.2 23.16,18.14 20.88,18.14 15.39,23.62 15.39,24.84 U3.3
D6  (via drill 0.35)
  Top 0.152: v24.23,13.41 24.38,13.56 24.38,14.17 IC7.10 | v35.92,53.19 33.83,53.19 DRV.7
  Bottom 0.152: v24.23,13.41 24.23,25.91 25.45,27.13 25.45,31.7 24.08,33.07 24.08,46.63 28.3,50.85 34.59,50.85 35.92,52.17 v35.92,53.19
D7  (via drill 0.35)
  Top 0.152: v23.93,10.67 24.84,11.58 24.84,14.17 IC7.11 | v26.06,8.53 34.59,8.53 34.9,8.84 36.42,8.84 39.32,5.94 LED.1
  Bottom 0.152: v26.06,8.53 v23.93,10.67
D8  (via drill 0.35)
  Top 0.152: IC7.12 25.3,14.17 25.3,11.12 22.1,7.92 13.82,7.92 12.9,8.84 10.97,8.84 10.41,9.4 10.41,11.33 v7.92,13.82 | v7.62,18.54 6.1,18.54 4.83,19.81 BLU_ON/OFF_D8.TP
  Bottom 0.152: v7.62,18.54 7.92,18.24 v7.92,13.82
D11/MOSI
  Top 0.152: IC7.15 26.98,14.17 26.98,10.36 25.45,8.84 25.45,5.94 J4.4
D12/MISO  (via drill 0.35)
  Top 0.152: v29.11,10.67 27.43,12.34 27.43,14.17 IC7.16 | v30.33,5.18 28.8,5.18 28.04,4.42 23.93,4.42 22.86,3.35 J4.1
  Bottom 0.152: v29.11,10.67 30.33,9.45 v30.33,5.18
D13/SCK  (via drill 0.35)
  Top 0.152: v29.72,9.14 29.72,11.28 28.19,12.8 28.19,14.94 IC7.17
  Bottom 0.152: v29.72,9.14 29.72,3.2 28.5,1.98 28.35,1.98 28.04,2.29 27.89,2.29 27.58,1.98 26.67,1.98 25.45,3.2 J4.3
GND  (via drill 0.35)
  Top 0.152: BATTERY.1 9.4,61.72 v6.35,64.77 | v5.33,60.45 5.33,58.89 INA.2 | INA.3 INA.2 | v34.54,56.13 35.65,57.24 C13.2 | 29.86,52.21 31.65,52.21 DRV.4 | v16.76,52.83 16.6,53 C10.2 10.43,53 C11.- 9.65,52.25 INA.8 5.79,56.08 5.18,56.08 INA.7 INA.2 | 29.86,52.21 28.96,51.31 BLE_TP4.TP 29.72,49.53 v29.97,49.53 | v31.24,45.21 Y2.2 | C15.2 25.91,43.35 v25.91,44.7 | v35.05,37.08 34.8,36.83 C12.2 | v12.45,23.62 12.45,24.3 C18.2 14.18,25.06 14.6,25.48 14.82,25.48 U3.2 | v11.18,20.07 12.83,20.07 C3.2 14.99,18.54 v16,17.53 | Y1.2 v16.51,11.94 | v14.22,8.64 14.1,8.76 C7.2 | SW1.1 10.92,6.6 v10.67,6.6 | v15.49,13.46 15.24,13.72 C5.2 | C1.2 v36.07,16.51 | v40.13,16.26 41.57,16.26 FSR_R2.1 | FSR_R1.1 42,9.91 v40.39,9.91 | v39.88,23.88 41.24,23.88 FSR_R3.1 41.4,26.84 FSR_R4.1 | BLE_R4.1 25.57,26.92 v24.38,26.92 | v23.37,31.75 23.11,32 23.11,34.76 BLE.13 23.2,36.92 24.13,37.85 BLE.49 | v21.84,17.53 23.19,17.53 IC7.3 23.34,17.38 23.58,17.38 24.2,16.76 IC7.33 | BLE.34 28.4,38.86 | 28.4,38.86 BLE.33 28.69,38.85 29.52,39.68 v29.68,39.68 | BLE.49 26.16,37.08 26.67,37.08 26.67,37.03 BLE.49 | IC7.33 25.9,17.01 IC7.21 v29.46,17.02 | IC7.33 23.7,16.76 23.58,16.64 23.34,16.64 IC7.5 | v44.45,4.32 44.45,3.81 42.8,3.81 42.32,4.29 40.36,4.29 LED.3 40.05,1.09 37.52,1.09 36.41,2.2 C19.2 31.73,5.27 IC6.1 30.76,5.84 J4.6 v27.94,7.62 | R1.1 33.19,34.38 v33.27,34.29 | F1.6 F1.5 | v36.07,41.66 F1.5 | F1.5 F1.2 | 28.4,38.86 28.36,38.83 27.99,38.83 27.02,37.85 BLE.49 | v5.33,22.86 5.33,23.88 4.95,24.26 | v9.4,17.02 9.27,17.14 C8.2 2.67,17.14 EMG_2_AGND.TP | v28.7,52.32 29.75,52.32 29.86,52.21 | ON/OFF_GND.TP 4.06,25.15 4.95,24.26 | BLU_ON/OFF_GND.TP 4.95,25.78 4.95,24.26
  Top 0.152: v5.59,8.13 3.81,8.13 IMU_GND.TP 3.56,9.91 EMG_1_GND.TP
  Bottom 0.152: v6.35,64.77 6.35,61.47 v5.33,60.45 | v34.54,56.13 32.51,56.13 29.21,52.83 | 29.21,52.83 v28.7,52.32 | v16.76,52.83 29.21,52.83 | v29.97,49.53 30.73,48.77 | 30.73,48.77 31.24,48.26 | 31.24,48.26 v31.24,45.21 | v25.91,44.7 29.97,48.77 30.73,48.77 | 31.24,48.26 32,47.5 33.53,47.5 34.29,46.74 34.29,43.43 v36.07,41.66 36.07,38.86 | 36.07,38.86 36.07,38.1 35.56,37.59 | 35.56,37.59 v35.05,37.08 | v12.45,23.62 12.45,22.61 | 12.45,22.61 12.45,21.34 v11.18,20.07 | 12.45,22.61 9.65,19.81 9.65,17.27 v9.4,17.02 8.38,18.03 8.38,19.81 v5.33,22.86 | v10.67,6.6 12.19,8.13 | 12.19,8.13 13.72,8.13 v14.22,8.64 16.51,10.92 v16.51,11.94 14.99,13.46 v15.49,13.46 16.76,13.46 18.54,15.24 19.3,15.24 | v36.07,16.51 37.08,16.51 | 37.08,16.51 37.85,16.51 | 37.85,16.51 39.88,16.51 v40.13,16.26 | v40.39,9.91 38.61,11.68 | 38.61,11.68 38.61,15.75 37.85,16.51 | 37.08,16.51 39.12,18.54 | 39.12,18.54 39.88,19.3 v39.88,23.88 | v24.38,26.92 23.37,27.94 | 23.37,27.94 v23.37,31.75 | 23.37,27.94 21.84,26.42 21.84,19.3 | 21.84,19.3 v21.84,17.53 | 19.3,15.24 21.08,17.02 21.08,17.27 | 21.84,19.3 21.08,18.54 21.08,17.27 | v29.72,37.34 30.99,38.61 | 30.99,38.61 31.24,38.86 36.07,38.86 | v29.46,17.02 29.97,16.51 31.5,16.51 32.26,17.27 32.26,18.03 32.77,18.54 39.12,18.54 | 38.61,11.68 38.61,8.38 39.37,7.62 43.69,7.62 44.45,6.86 v44.45,4.32 | v27.94,7.62 20.32,15.24 19.3,15.24 | v16,17.53 20.83,17.53 21.08,17.27 | v5.59,8.13 6.1,8.64 11.68,8.64 12.19,8.13 | v33.27,34.29 35.56,36.58 35.56,37.59 | v29.68,39.68 29.91,39.68 30.99,38.61
  pour Bottom: -2.54,72.39 50.8,72.39 54.61,68.58 54.61,-1.27 49.53,-6.35 -2.54,-6.35 -6.35,-2.54 -6.35,68.58
  cutout Bottom: 26.16,33.53 26.16,31.5 26.42,31.24 27.43,31.24 27.43,33.53
  cutout Bottom: 30.23,40.39 30.23,39.88 30.73,39.37 31.75,40.39 34.8,40.39 34.8,40.89 35.05,41.15 34.8,41.15 34.29,41.66 32.77,41.66 32.51,41.4 31.24,41.4
  cutout Bottom: 30.99,54.1 31.24,54.36 34.29,54.36 34.54,54.1 34.54,51.82 34.04,51.31 33.78,51.31 31.24,51.31
  cutout Bottom: 38.61,53.09 38.61,54.36 38.86,54.61 39.88,54.61 43.18,51.31 42.16,50.29 41.66,50.29 41.4,50.29
  cutout Bottom: 38.61,56.9 39.62,56.9 39.88,56.64 45.21,51.31 45.21,50.04 45.47,49.78 45.47,46.48 44.2,46.48 43.94,46.74 43.69,46.99 43.69,50.8 38.61,55.88 38.35,55.88 38.35,56.64
  cutout Bottom: 18.03,13.72 18.29,13.97 20.32,13.97 20.83,13.46 20.83,10.16 20.32,9.65 18.29,9.65 18.03,9.91
  cutout Bottom: 29.21,44.7 29.21,42.16 33.02,42.16 33.27,42.42 33.27,44.7
  cutout Bottom: 2.54,59.44 2.79,59.69 6.6,59.69 7.11,59.18 7.11,55.37 6.35,54.61 3.05,54.61 2.54,55.12
  cutout Bottom: 21.34,41.66 21.59,41.4 28.96,41.4 28.96,34.29 28.7,34.04 21.59,34.04 21.59,41.4
  cutout Bottom: 35.31,66.04 38.61,69.34 42.16,69.34 49.28,62.23 49.28,53.34 48.77,52.83 44.45,52.83 35.31,61.98
N$1
  Top 0.152: BLE.24 27.7,34.44 30.02,34.44 31.7,32.77 R1.2 31.85,32.61 32.46,32 BLE_TP1.TP
N$2
  Top 0.152: BLE.23 27.22,34.83 27.22,34.44 27.44,34.22 27.48,34.22 27.5,34.2 27.57,34.14 27.61,34.14 27.64,34.12 28.74,33.02 BLE_TP2.TP
N$4
  Top 0.152: BATTERY.2 11.94,61.72 D3.A 8.92,58.7 INA.1
N$5
  Top 0.152: F1.1 39.22,41.25 39.57,41.25 41.15,42.83 41.15,61.93 U$11.FEED
N$6
  Top 0.152: BLE.31 29.94,38.01 34.75,42.82 38.41,42.82 38.86,42.37 F1.3
N$7  (via drill 0.35)
  Top 0.152: BLE.32 29.3,38.45 30.73,39.88 v30.73,40.15 | v34.29,40.89 35.7,42.31 F1.4
  Bottom 0.152: v30.73,40.15 31.47,40.89 v34.29,40.89
N$8
  Top 0.152: C12.1 31.32,36.48 29.67,36.48 28.91,37.25 BLE.29
N$9  (via drill 0.35)
  Top 0.152: BLE_R4.2 27.74,27.43 27.58,27.58 27.58,29.97 BLE_R3.1 27.52,30.9 26.92,31.5 v26.92,31.55 | BLE.17 24.82,34.83 24.82,34.44 26.24,33.02 v26.67,33.02
  Bottom 0.152: v26.92,31.55 26.67,31.8 v26.67,33.02
N$10
  Top 0.152: C15.1 26.8,42.21 BLE.39
N$11
  Top 0.152: Y1.1 21.88,15.51 IC7.7
N$12
  Top 0.152: Y1.3 19.73,11.36 20.4,11.36 23.2,14.16 IC7.8
N$13
  Top 0.152: BLE.1 21.76,40.05 20.41,38.7 16.51,38.7 C16.2 17.19,37.93 20.57,34.55 21.81,34.55 22.4,35.14 BLE.12
N$14
  Top 0.152: C17.2 12.04,39.47 18.9,39.47 25.3,45.87 31.55,45.87 32.92,44.5 32.92,42.37 32.11,41.55 30.84,41.55 29.47,40.3 28.65,40.3 BLE.36 28.5,39.93 28.5,39.78 BLE.35
N$17
  Top 0.152: 32.16,42.67 32.16,43.43 Y2.3 32.16,42.67 | 32.16,42.67 31.55,42.06 30.79,42.06 29.72,41 27.74,41 BLE.37
OUT1
  Top 0.152: MOTORE.1 21.5,63.33 C14.1 23.03,58.42 24.36,58.42 30.2,52.58 DRV.3
OUT2
  Top 0.152: MOTORE.2 26.76,63.5 C14.2 24.61,59.94 31.34,53.21 31.65,53.21 DRV.2
RESET  (via drill 0.35)
  Top 0.152: SW1.2 17.02,4.51 v17.02,3.3 | v27.94,1.39 J4.5 | 24.99,19.96 25.3,19.66 25.3,19.36 IC7.29 | 24.99,19.96 22.86,22.1 22.86,28.5 RP1.4 | 24.99,19.96 25.15,19.96 v25.3,20.12
  Bottom 0.152: v17.02,3.3 19.05,1.27 27.94,1.27 v27.94,1.39 | v25.3,20.12 25.3,11.12 29.41,7.01 29.41,4.72 28.04,3.35 J4.5
RX
  Top 0.152: RP1.8 20.71,30.21 20.71,30.3 21.39,30.99 23.62,30.99 24,31.37 BLE.15
TX
  Top 0.152: BLE_R3.2 24.33,29.97 23.62,29.26 21.64,29.26 21.34,29.57 21.34,29.87 RP1.7
VIN  (via drill 0.35)
  Top 0.152: DRV.1 31.78,62.45 25.33,68.91 20.07,68.91 17.53,66.37 D3.C 17.53,57.49 16.14,56.1 | 16.14,56.1 C10.1 9.92,54.7 C11.+ | v35.2,8.23 36.27,7.16 36.27,6.86 IC6.3 | 16.14,56.1 v25.3,46.94
  Bottom 0.152: v35.2,8.23 35.2,9.91 28.04,17.07 28.5,17.53 28.5,40.23 27.58,41.15 27.58,41.45 27.89,41.76 25.3,44.35 v25.3,46.94
XC2
  Top 0.152: BLE.38 27.2,41.68 27.43,41.91 29.72,41.91 30.24,42.43 Y2.1
~D9  (via drill 0.35)
  Top 0.152: v25.91,13.41 25.91,14.17 IC7.13 | v24.69,46.18 27.89,46.18 33.68,51.97 DRV.5
  Bottom 0.152: v25.91,13.41 25.91,43.28 24.69,44.5 v24.69,46.18
~D10  (via drill 0.35)
  Top 0.152: v26.36,12.5 26.52,12.65 26.52,14.17 IC7.14 | v27.43,20.88 43.28,36.73 43.28,50.19 v42.16,51.31 | DRV.6 33.83,52.58 36.73,52.58 37.8,53.65 37.85,53.59 v39.12,53.59
  Bottom 0.152: v26.36,12.5 26.36,12.95 27.43,14.02 v27.43,20.88 | v39.12,53.59 41.4,51.31 v42.16,51.31

### Text on the board
tNames: GRUPPO_E | V_7